# Altium schematic sheet White_LED_Section.SchDoc
size A
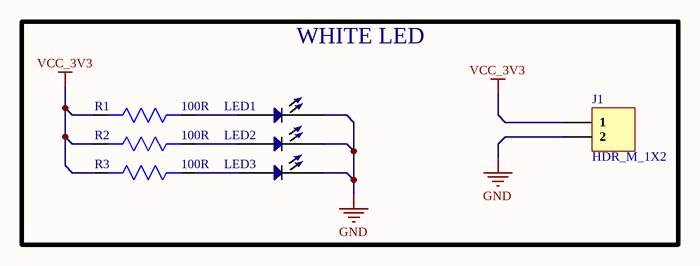
[diagram p0: White_LED_Section.SchDoc]

## Parts
J1  HDR_M_1X2  [HDR_M_1X2]
LED1  SZYY0402W  [LED 0402]  (value not drawn)
LED2  SZYY0402W  [LED 0402]  (value not drawn)
LED3  SZYY0402W  [LED 0402]  (value not drawn)
R1  100R  [RES-0603]
R2  100R  [RES-0603]
R3  100R  [RES-0603]

## Blocks framed on the sheet
WHITE LED: J1 LED1-LED3 R1-R3

## Nets
GND: J1.2 LED1.2 LED2.2 LED3.2
VCC_3V3: J1.1 R1.2 R2.2 R3.2
NetLED1_1: LED1.1 R1.1
NetLED2_1: LED2.1 R2.1
NetLED3_1: LED3.1 R3.1

## Library data of the parts
J1 = HDR_M_1X2: 2 POS 2.54mm spacer header; Manufacturer: E-SIMPO; Current rating: 1A; Pitch: 2.54mm; ComponentLink1Description: AliE; ComponentLink1URL: https://www.aliexpress.com/item/32896225776.html?spm=a2g0o.productlist.0.0.64116a18Q9OFX2&algo_pvid=aef74b9f-f029-40ba-a87b-4c3df7d87b26&algo_exp_id=aef74b9f-f029-40ba-a87b-4c3df7d87b26-3&pdp_ext_f=%7B%22sku_id%22%3A%2265850500267%22%7D&pdp_pi=-1%3B2.79%3B-1%3BUSD+3.72%40salePrice%3BUSD%3Bsearch-mainSearch
LED1-LED3 = SZYY0402W: 300mcd 2.8V Colorless transparence -40℃~+85℃ White light 16mW 0402 Light Emitting Diodes (LED) ROHS; Manufacturer: Yongyu Photoelectric; Manufacturer Part num: SZYY0402W; Footprint: 0402
R1-R3 = RCA0603100RFKEAHP: RES SMD 100 OHM 1% 1/4W 0603; Manufacturer: Vishay Dale; Max Power Dissipation: 250mW; Temperature Coefficient: 100ppm/°C; Supplier 1: Digi-Key; Manufacturer Part Number: RCA0603100RFKEAHP; Stock 1: 0; Case/Package: 0603; Case Code (Imperial): 0603; Case Code (Metric): 1608; Min Operating Temperature: -55°C; Max Operating Temperature: 155°C; Resistor Type: Thick Film; Features: Automotive AEC-Q200,Anti-Sulfur; Packaging: Tape and Reel; Resistance: 100R; Tolerance: 1%; Number of Terminations: 2; RoHS Compliant: Yes; ComponentLink1URL: http://www.vishay.com/docs/20067/rcahp.pdf?src-supplier=Digi-Key; ComponentLink1Description: http://www.vishay.com/docs/20067/rcahp.pdf?src-supplier=Digi-Key; Supplier Part Number 1: 541-3244-2-ND